# Altium schematic sheet analog-joystick.SchDoc
size A4; SheetNumber: 7; SheetTotal: 14
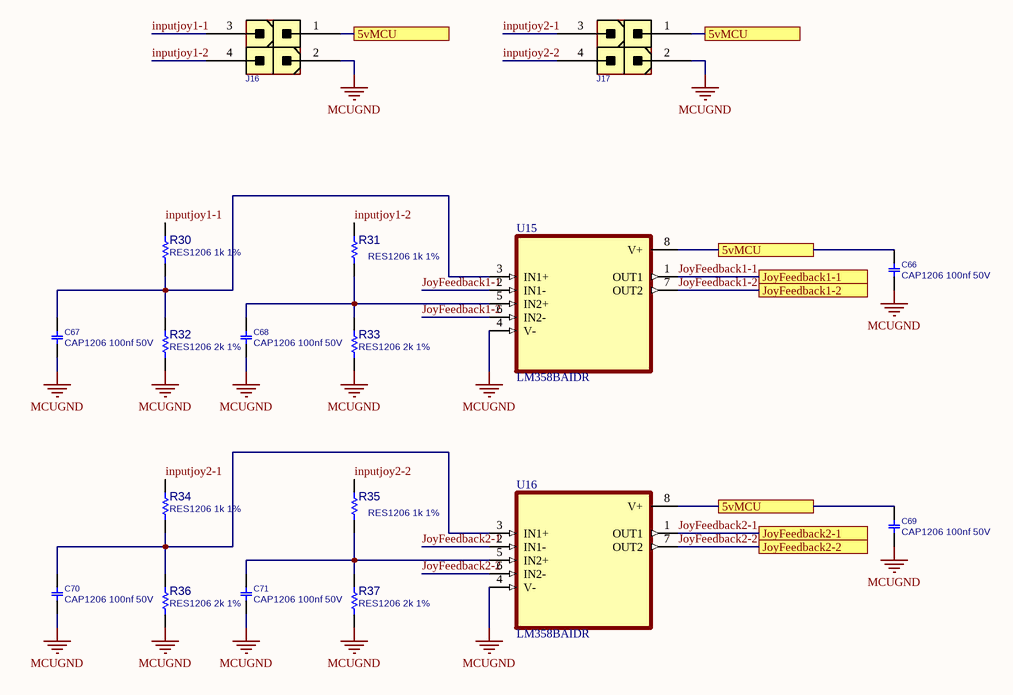
[diagram p0: analog-joystick.SchDoc]

## Parts
C66  CAP1206 100nf 50V  [C1206]
C67  CAP1206 100nf 50V  [C1206]
C68  CAP1206 100nf 50V  [C1206]
C69  CAP1206 100nf 50V  [C1206]
C70  CAP1206 100nf 50V  [C1206]
C71  CAP1206 100nf 50V  [C1206]
J16  CONN_ATXPWR_4  [ATXPWR_4]  (value not drawn)
J17  CONN_ATXPWR_4  [ATXPWR_4]  (value not drawn)
R30  RES1206 1k 1%  [R1206]
R31  RES1206 1k 1%  [R1206]
R32  RES1206 2k 1%  [R1206]
R33  RES1206 2k 1%  [R1206]
R34  RES1206 1k 1%  [R1206]
R35  RES1206 1k 1%  [R1206]
R36  RES1206 2k 1%  [R1206]
R37  RES1206 2k 1%  [R1206]
U15  LM358BAIDR  [SOIC127P599X175-8N]
U16  LM358BAIDR  [SOIC127P599X175-8N]

## Ports
5vMCU, JoyFeedback1-1, JoyFeedback1-2, JoyFeedback2-1, JoyFeedback2-2

## Nets
MCUGND: C66.1 C67.2 C68.2 C69.1 C70.2 C71.2 J16.2 J17.2 R32.2 R33.2 R36.2 R37.2 U15.4(V-) U16.4(V-)
5vMCU: C66.2 C69.2 J16.1 J17.1 U15.8(V+) U16.8(V+) ; port 5vMCU
inputjoy1-1: J16.3 R30.1
inputjoy1-2: J16.4 R31.1
inputjoy2-1: J17.3 R34.1
inputjoy2-2: J17.4 R35.1
JoyFeedback1-1: U15.1(OUT1) U15.2(IN1-) ; port JoyFeedback1-1
JoyFeedback1-2: U15.6(IN2-) U15.7(OUT2) ; port JoyFeedback1-2
JoyFeedback2-1: U16.1(OUT1) U16.2(IN1-) ; port JoyFeedback2-1
JoyFeedback2-2: U16.6(IN2-) U16.7(OUT2) ; port JoyFeedback2-2
NetC67_1: C67.1 R30.2 R32.1 U15.3(IN1+)
NetC68_1: C68.1 R31.2 R33.1 U15.5(IN2+)
NetC70_1: C70.1 R34.2 R36.1 U16.3(IN1+)
NetC71_1: C71.1 R35.2 R37.1 U16.5(IN2+)

## Library data of the parts
C66-C71 = CAP_SMD_MLCC_1206: CAP, MLCC; PARAM: -, -%; MANF_P#: MANF_PART#; PARAM2: -V; PRICE: 100= 1$; MANF: -; ASSEMBLY: ASSEMBLY
J16 J17 = CONN_ATXPWR_4: CONN, ATX POWER, 4 P; MANF: TE, Molex; MANF_P#: 4-1775099-0, 39281043; VALUE: CONN_ATXPWR_4; MountType: THD; PACKAGE: ATXPWR-4pin; Part Type: Conn.
R30-R37 = RES_SMD_1206: RESISTOR, SMD; PARAM: 1%, 0.25W; DESC: DESCRIPTION; DIST#: MOUSER; MANF_P#: -; MANF: -; ASSEMBLY: ASSEMBLY; PRICE: -; PARAM2: -
U15 U16 = LM358BAIDR: Dual, 36-V, 1.2-MHz, 2-mV offset voltage operational amplifier; MF: Texas Instruments; SnapEDA_Link: https://www.snapeda.com/parts/LM358BAIDR/Texas+Instruments/view-part/?ref=snap; Package: SOIC-8 Texas Instruments; Value: *; MP: LM358BAIDR; Check_prices: https://www.snapeda.com/parts/LM358BAIDR/Texas+Instruments/view-part/?ref=eda